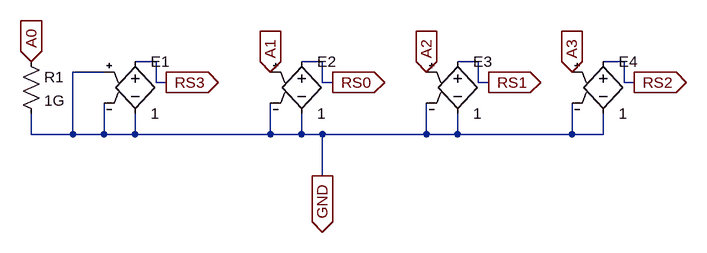
[diagram p0: schematic 4bit_RightShift.asc]
4bit_RightShift.asc, the LTspice schematic file:
Version 4.1
SHEET 1 920 680
WIRE 80 96 48 96
WIRE 336 96 304 96
WIRE 576 96 544 96
WIRE 800 96 768 96
WIRE 0 112 -48 112
WIRE 80 128 80 96
WIRE 96 128 80 128
WIRE 336 128 336 96
WIRE 352 128 336 128
WIRE 576 128 576 96
WIRE 592 128 576 128
WIRE 800 128 800 96
WIRE 816 128 800 128
WIRE -112 208 -112 176
WIRE -48 208 -48 112
WIRE -48 208 -112 208
WIRE 0 208 0 160
WIRE 0 208 -48 208
WIRE 48 208 48 176
WIRE 48 208 0 208
WIRE 256 208 256 160
WIRE 256 208 48 208
WIRE 304 208 304 176
WIRE 304 208 256 208
WIRE 336 208 304 208
WIRE 496 208 496 160
WIRE 496 208 336 208
WIRE 544 208 544 176
WIRE 544 208 496 208
WIRE 720 208 720 160
WIRE 720 208 544 208
WIRE 768 208 768 176
WIRE 768 208 720 208
WIRE 336 272 336 208
FLAG -112 96 A0
IOPIN -112 96 In
FLAG 256 112 A1
IOPIN 256 112 In
FLAG 496 112 A2
IOPIN 496 112 In
FLAG 720 112 A3
IOPIN 720 112 In
FLAG 96 128 RS3
IOPIN 96 128 Out
FLAG 352 128 RS0
IOPIN 352 128 Out
FLAG 592 128 RS1
IOPIN 592 128 Out
FLAG 816 128 RS2
IOPIN 816 128 Out
FLAG 336 272 GND
IOPIN 336 272 Out
SYMBOL e 48 80 R0
SYMATTR InstName E1
SYMATTR Value 1
SYMBOL e 304 80 R0
SYMATTR InstName E2
SYMATTR Value 1
SYMBOL e 544 80 R0
SYMATTR InstName E3
SYMATTR Value 1
SYMBOL e 768 80 R0
SYMATTR InstName E4
SYMATTR Value 1
SYMBOL res -128 80 R0
SYMATTR InstName R1
SYMATTR Value 1G

The netlist it stands for:
* 4bit_RightShift.asc
E1 RS3 GND GND GND 1
E2 RS0 GND A1 GND 1
E3 RS1 GND A2 GND 1
E4 RS2 GND A3 GND 1
R1 A0 GND 1G
.backanno
.end